# Altium schematic sheet Main_branch.SchDoc
size A4; SheetNumber: 2; SheetTotal: 6
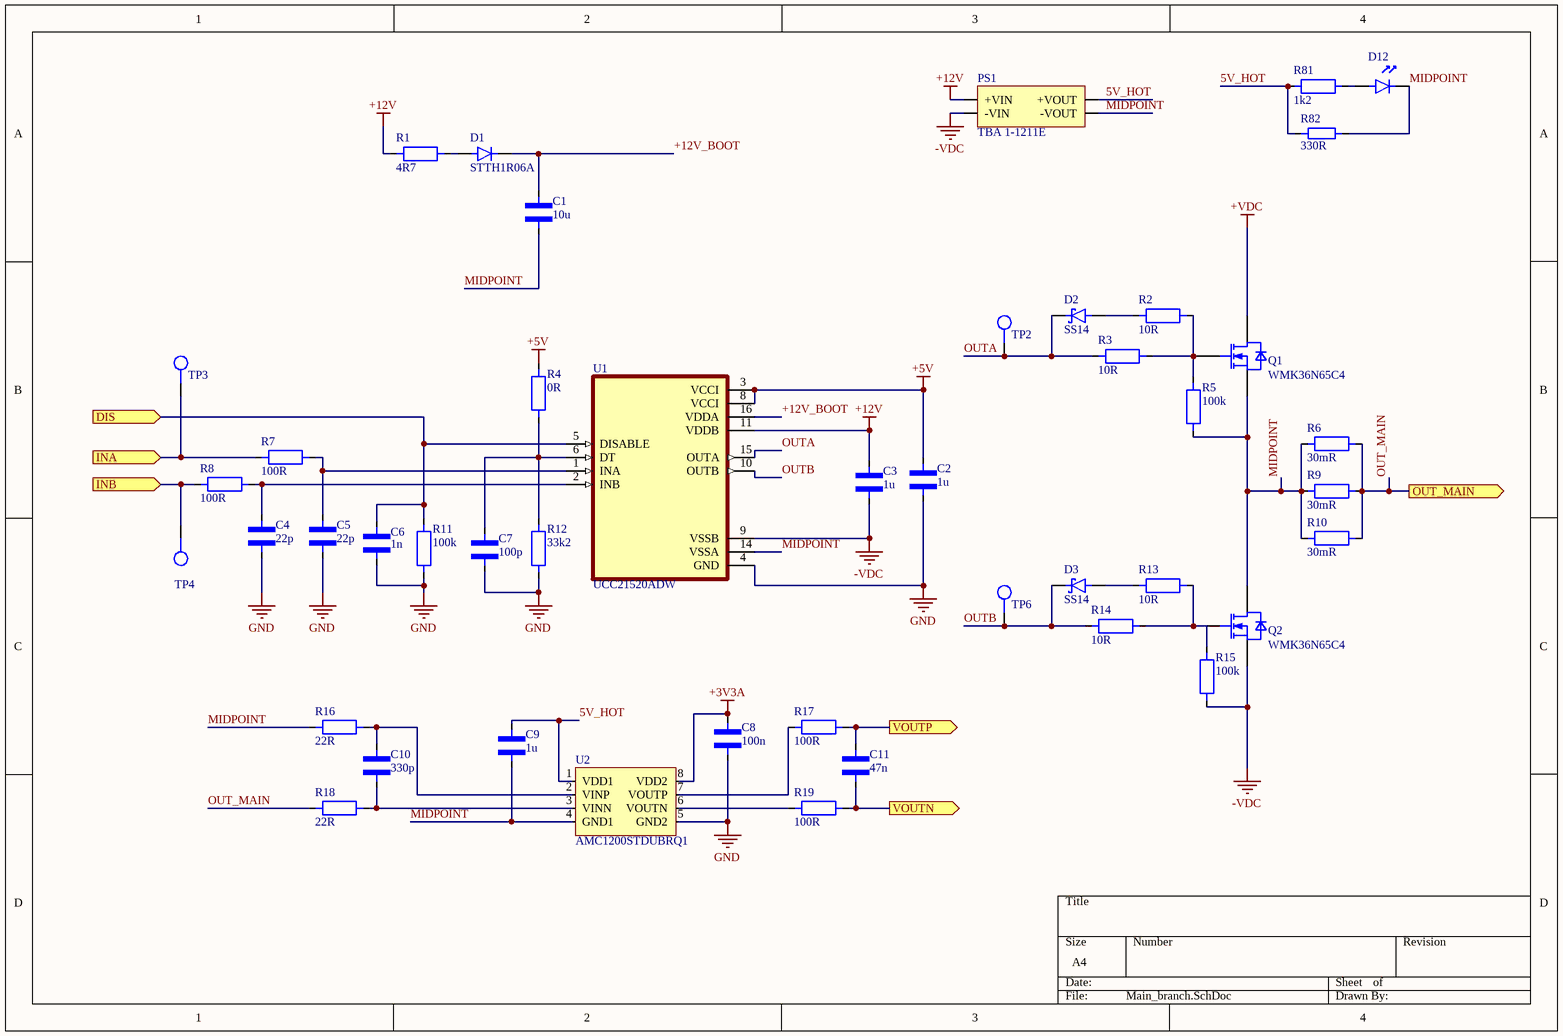
[diagram p0: Main_branch.SchDoc]

## Parts
C1  10u  [CAPACITOR_1206]
C2  1u  [Capacitor_0805]
C3  1u  [Capacitor_0805]
C4  22p  [Capacitor_0805]
C5  22p  [Capacitor_0805]
C6  1n  [Capacitor_0805]
C7  100p  [Capacitor_0805]
C8  100n  [Capacitor_0805]
C9  1u  [Capacitor_0805]
C10  330p  [Capacitor_0805]
C11  47n  [Capacitor_0805]
D1  STTH1R06A  [STTH1R06A]
D2  SS14  [DIOM5226X230N]
D3  SS14  [DIOM5226X230N]
D12  LTST-C171KRKT  [LTST-C171K]  (value not drawn)
PS1  TBA 1-1211E  [TBA 1-1211E]
Q1  WMK36N65C4  [TO220-3]
Q2  WMK36N65C4  [TO220-3]
R1  4R7  [RESISTOR_1206]
R2  10R  [RESISTOR_0805]
R3  10R  [RESISTOR_0805]
R4  0R  [RESISTOR_0805]
R5  100k  [RESISTOR_0805]
R6  30mR  [MAR251203FR030S]
R7  100R  [RESISTOR_0805]
R8  100R  [RESISTOR_0805]
R9  30mR  [MAR251203FR030S]
R10  30mR  [MAR251203FR030S]
R11  100k  [RESISTOR_0805]
R12  33k2  [RESISTOR_0805]
R13  10R  [RESISTOR_0805]
R14  10R  [RESISTOR_0805]
R15  100k  [RESISTOR_0805]
R16  22R  [RESISTOR_0805]
R17  100R  [RESISTOR_0805]
R18  22R  [RESISTOR_0805]
R19  100R  [RESISTOR_0805]
R81  1k2  [RESISTOR_0805]
R82  330R  [RESISTOR_1206]
TP2  TestPoint  [TestPoint_1.5mm]  (value not drawn)
TP3  TestPoint  [TestPoint_1.5mm]  (value not drawn)
TP4  TestPoint  [TestPoint_1.5mm]  (value not drawn)
TP6  TestPoint  [TestPoint_1.5mm]  (value not drawn)
U1  UCC21520ADW  [UCC21520ADW]
U2  AMC1200STDUBRQ1  [SOP254P1040X485-8N]

## Ports
DIS (in), INA (in), INB (in), OUT_MAIN (out), VOUTN (out), VOUTP (out)

## Nets
+3V3A: C8.2 U2.8(VDD2)
+5V: C2.1 R4.2 U1.3(VCCI) U1.8(VCCI)
+12V: C3.2 PS1.1(+VIN) R1.1 U1.11(VDDB)
+VDC: Q1.2(DRAIN)
-VDC: C3.1 PS1.2(-VIN) Q2.3(SOURCE) R15.1 U1.9(VSSB)
GND: C2.2 C4.1 C5.1 C6.1 C7.1 C8.1 R11.1 R12.1 U1.4(GND) U2.5(GND2)
5V_HOT: C9.2 PS1.4(+VOUT) R81.1 R82.1 U2.1(VDD1)
+12V_BOOT: C1.1 D1.2(K) U1.16(VDDA)
DIS: C6.2 R11.2 U1.5(DISABLE) ; port DIS
INA: R7.1 TP3.1 ; port INA
INB: R8.1 TP4.1 ; port INB
MIDPOINT: C1.2 C9.1 D12.2(K) PS1.3(-VOUT) Q1.3(SOURCE) Q2.2(DRAIN) R5.1 R6.1 R9.1 R10.1 R16.1 R82.2 U1.14(VSSA) U2.4(GND1)
OUT_MAIN: R6.2 R9.2 R10.2 R18.1 ; port OUT_MAIN
OUTA: D2.2(K) R3.1 TP2.1 U1.15(OUTA)
OUTB: D3.2(K) R14.1 TP6.1 U1.10(OUTB)
VOUTN: C11.1 R19.2 ; port VOUTN
VOUTP: C11.2 R17.2 ; port VOUTP
NetC4_2: C4.2 R8.2 U1.2(INB)
NetC5_2: C5.2 R7.2 U1.1(INA)
NetC7_2: C7.2 R4.1 R12.2 U1.6(DT)
NetC10_1: C10.1 R18.2 U2.3(VINN)
NetC10_2: C10.2 R16.2 U2.2(VINP)
NetD1_1: D1.1(A) R1.2
NetD2_1: D2.1(A) R2.1
NetD3_1: D3.1(A) R13.1
NetD12_1: D12.1(A) R81.2
NetQ1_1: Q1.1(GATE) R2.2 R3.2 R5.2
NetQ2_1: Q2.1(GATE) R13.2 R14.2 R15.2
NetR17_1: R17.1 U2.7(VOUTP)
NetR19_1: R19.1 U2.6(VOUTN)

## Library data of the parts
C1 = CAPACITOR_1206: MLCC capacitor in 1206 package
C2-C11 = CAPACITOR_0805: MLCC capacitor in 0805 package
D1 = STTH1R06A: Diode: rectifying; SMD; 600V; 1A; 25ns; SMA; Ufmax: 1V; Ifsm: 20A
D2 D3 = SS14: 1A, 40V, Schottky Rectifier; MF: Taiwan Semiconductor; SnapEDA_Link: https://www.snapeda.com/parts/SS14/taiwan/view-part/?ref=snap; Package: SMA-2 Taiwan Semiconductor; MP: SS14; Check_prices: https://www.snapeda.com/parts/SS14/taiwan/view-part/?ref=eda
D12 = LTST-C171KRKT: LED; red; SMD; 0805; 18÷54mcd; 2÷2.4VDC; 2x1.25x0.8mm; 130°; 20mA
PS1 = TBA 1-1211E: Converter: DC/DC; 1W; Uin: 10.8÷13.2VDC; Uout: 5VDC; Iout: 200mA; pin to pad: 3>4 4>6
Q1 Q2 = WMK36N65C4: Transistor: N-MOSFET; WMOS™ C4; unipolar; 650V; 20A; Idm: 100A; 277W; Manufacturer: WAYON; ManufacturerPartNumber: WMK36N65C4; PackageReference: PG-TO220
R1 R82 = RESISTOR_1206: SMD resistor in 1206 package
R2-R5 R7 R8 R13-R19 R81 = RESISTOR_0805: SMD resistor in 0805 package
  R7: Value: 100R
R6 R9 R10 = MAR251203FR030S: Resistor: thick film; 30mΩ; sensing; SMD; 2512; 3W; ±1%; -55÷170°C; Manufacturer: Wayon; Value: 30mR; ComponentLink1Description: TME; ComponentLink1URL: https://www.tme.eu/pl/details/mar251203fr010s/rezystory-smd/wayon/; Power: 3W; Tolerance: 1%
R11 R12 = RESISTOR_0805: SMD resistor in 0805 package; Value: 100R
U1 = UCC21520ADW: 5.7kVrms, 4A/6A dual-channel isolated gate driver w/ dual input, disable pin, 8V UVLO in DW package; MF: Texas Instruments; SnapEDA_Link: https://www.snapeda.com/parts/UCC21520ADW/Texas+Instruments/view-part/?ref=snap; Package: SOIC-16 Texas Instruments; Value: *; MP: UCC21520ADW; Check_prices: https://www.snapeda.com/parts/UCC21520ADW/Texas+Instruments/view-part/?ref=eda
U2 = AMC1200: AMC1200/B Fully-Differential Isolation Amplifier; Manufacturer: Texas Instruments